# Altium schematic sheet MT-20S4A_2.SchDoc: MT-20S4A-2YLG
size 410 x 297 mm; ApprovedBy: Стерхов В.Д.; CheckedBy: Стерхов В.Д.; Author: Сергеев Д.А.; CompanyName: ГК СНАБЖЕНИЕ; DrawnBy: Сергеев Д.А.; Engineer: Сергеев Д.А.; Organization: ГК СНАБЖЕНИЕ; DocumentNumber: MT-20S4A-2YLG; Revision: 1; SheetNumber: 2; SheetTotal: 2
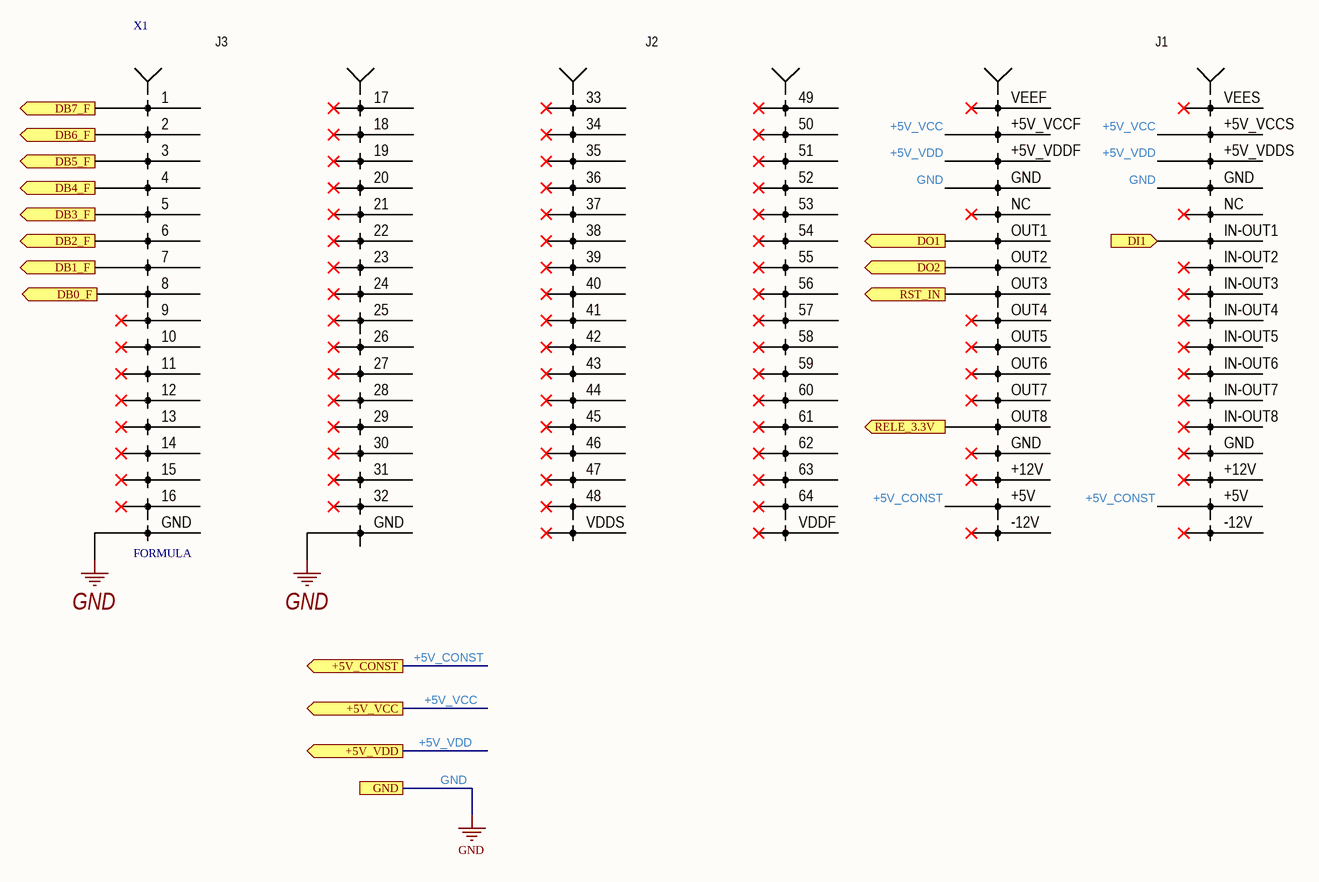
[diagram p0: MT-20S4A_2.SchDoc]

## Parts
X1  FORMULA  [FORMULA]

## Ports
+5V_CONST (out), +5V_VCC (out), +5V_VDD (out), DB0_F (out), DB1_F (out), DB2_F (out), DB3_F (out), DB4_F (out), DB5_F (out), DB6_F (out), DB7_F (out), DI1 (in), DO1 (out), DO2 (out), GND, RELE_3.3V (out), RST_IN (out)

## Nets
GND: X1.GND ; port GND
+5V_CONST: X1.+5V ; port +5V_CONST
+5V_VCC: X1.+5V_VCCF(VCCF) X1.+5V_VCCS(VCCS) ; port +5V_VCC
+5V_VDD: X1.+5V_VDDF(VDDF) X1.+5V_VDDS(VDDS) ; port +5V_VDD
DB0_F: X1.8 ; port DB0_F
DB1_F: X1.7 ; port DB1_F
DB2_F: X1.6 ; port DB2_F
DB3_F: X1.5 ; port DB3_F
DB4_F: X1.4 ; port DB4_F
DB5_F: X1.3 ; port DB5_F
DB6_F: X1.2 ; port DB6_F
DB7_F: X1.1 ; port DB7_F
DI1: X1.IN-OUT1 ; port DI1
DO1: X1.OUT1 ; port DO1
DO2: X1.OUT2 ; port DO2
RELE_3.3V: X1.OUT8 ; port RELE_3.3V
RST_IN: X1.OUT3 ; port RST_IN

Not connected (* = marked no-connect by the designer): X1 9* 10* 11* 12* 13* 14* 15* 16* 17* 18* 19* 20* 21* 22* 23* 24* 25* 26* 27* 28* 29* 30* 31* 32* 33* 34* 35* 36(4)* 37(5)* 38* 39* 40* 41* 42* 43* 44* 45* 46* 47* 48* 49* 50* 51* 52* 53* 54* 55* 56* 57* 58* 59* 60* 61* 62* 63* 64* +12V* -12V* IN-OUT2* IN-OUT3* IN-OUT4* IN-OUT5* IN-OUT6* IN-OUT7* IN-OUT8* NC* OUT4* OUT5* OUT6* OUT7* VDDF* VDDS* VEEF* VEES*

## Notes on the sheet
- Перв. примен.
- Справ. №
- Подп. и дата
- Инв. № дубл.
- Взам. инв. №
- Разраб.
- Изм.
- Лист
- № докум.
- Подп.
- Дата
- Литера
- Масса
- Масштаб
- Пров.
- Т.контр.
- Листов
- Инв. № подл.
- Н.контр.
- Утв.
- Форма 1 ГОСТ 2.104-2006
- Копировал
- Формат А3
- (in symbol FORMULA) J3; J2; J1